# EasyEDA Pro project mspm0g3507.epro

# Schematic Schematic1
Assembly Variant: Basic; Board Name: Board1; Create Date: 2026-08-04; Page Name: P1; Project Name: mspm0g3507; Schematic Name: Schematic1; Update Date: 2026-08-04; Company: 嘉立创EDA; Page Size: A4; Version: V1.0
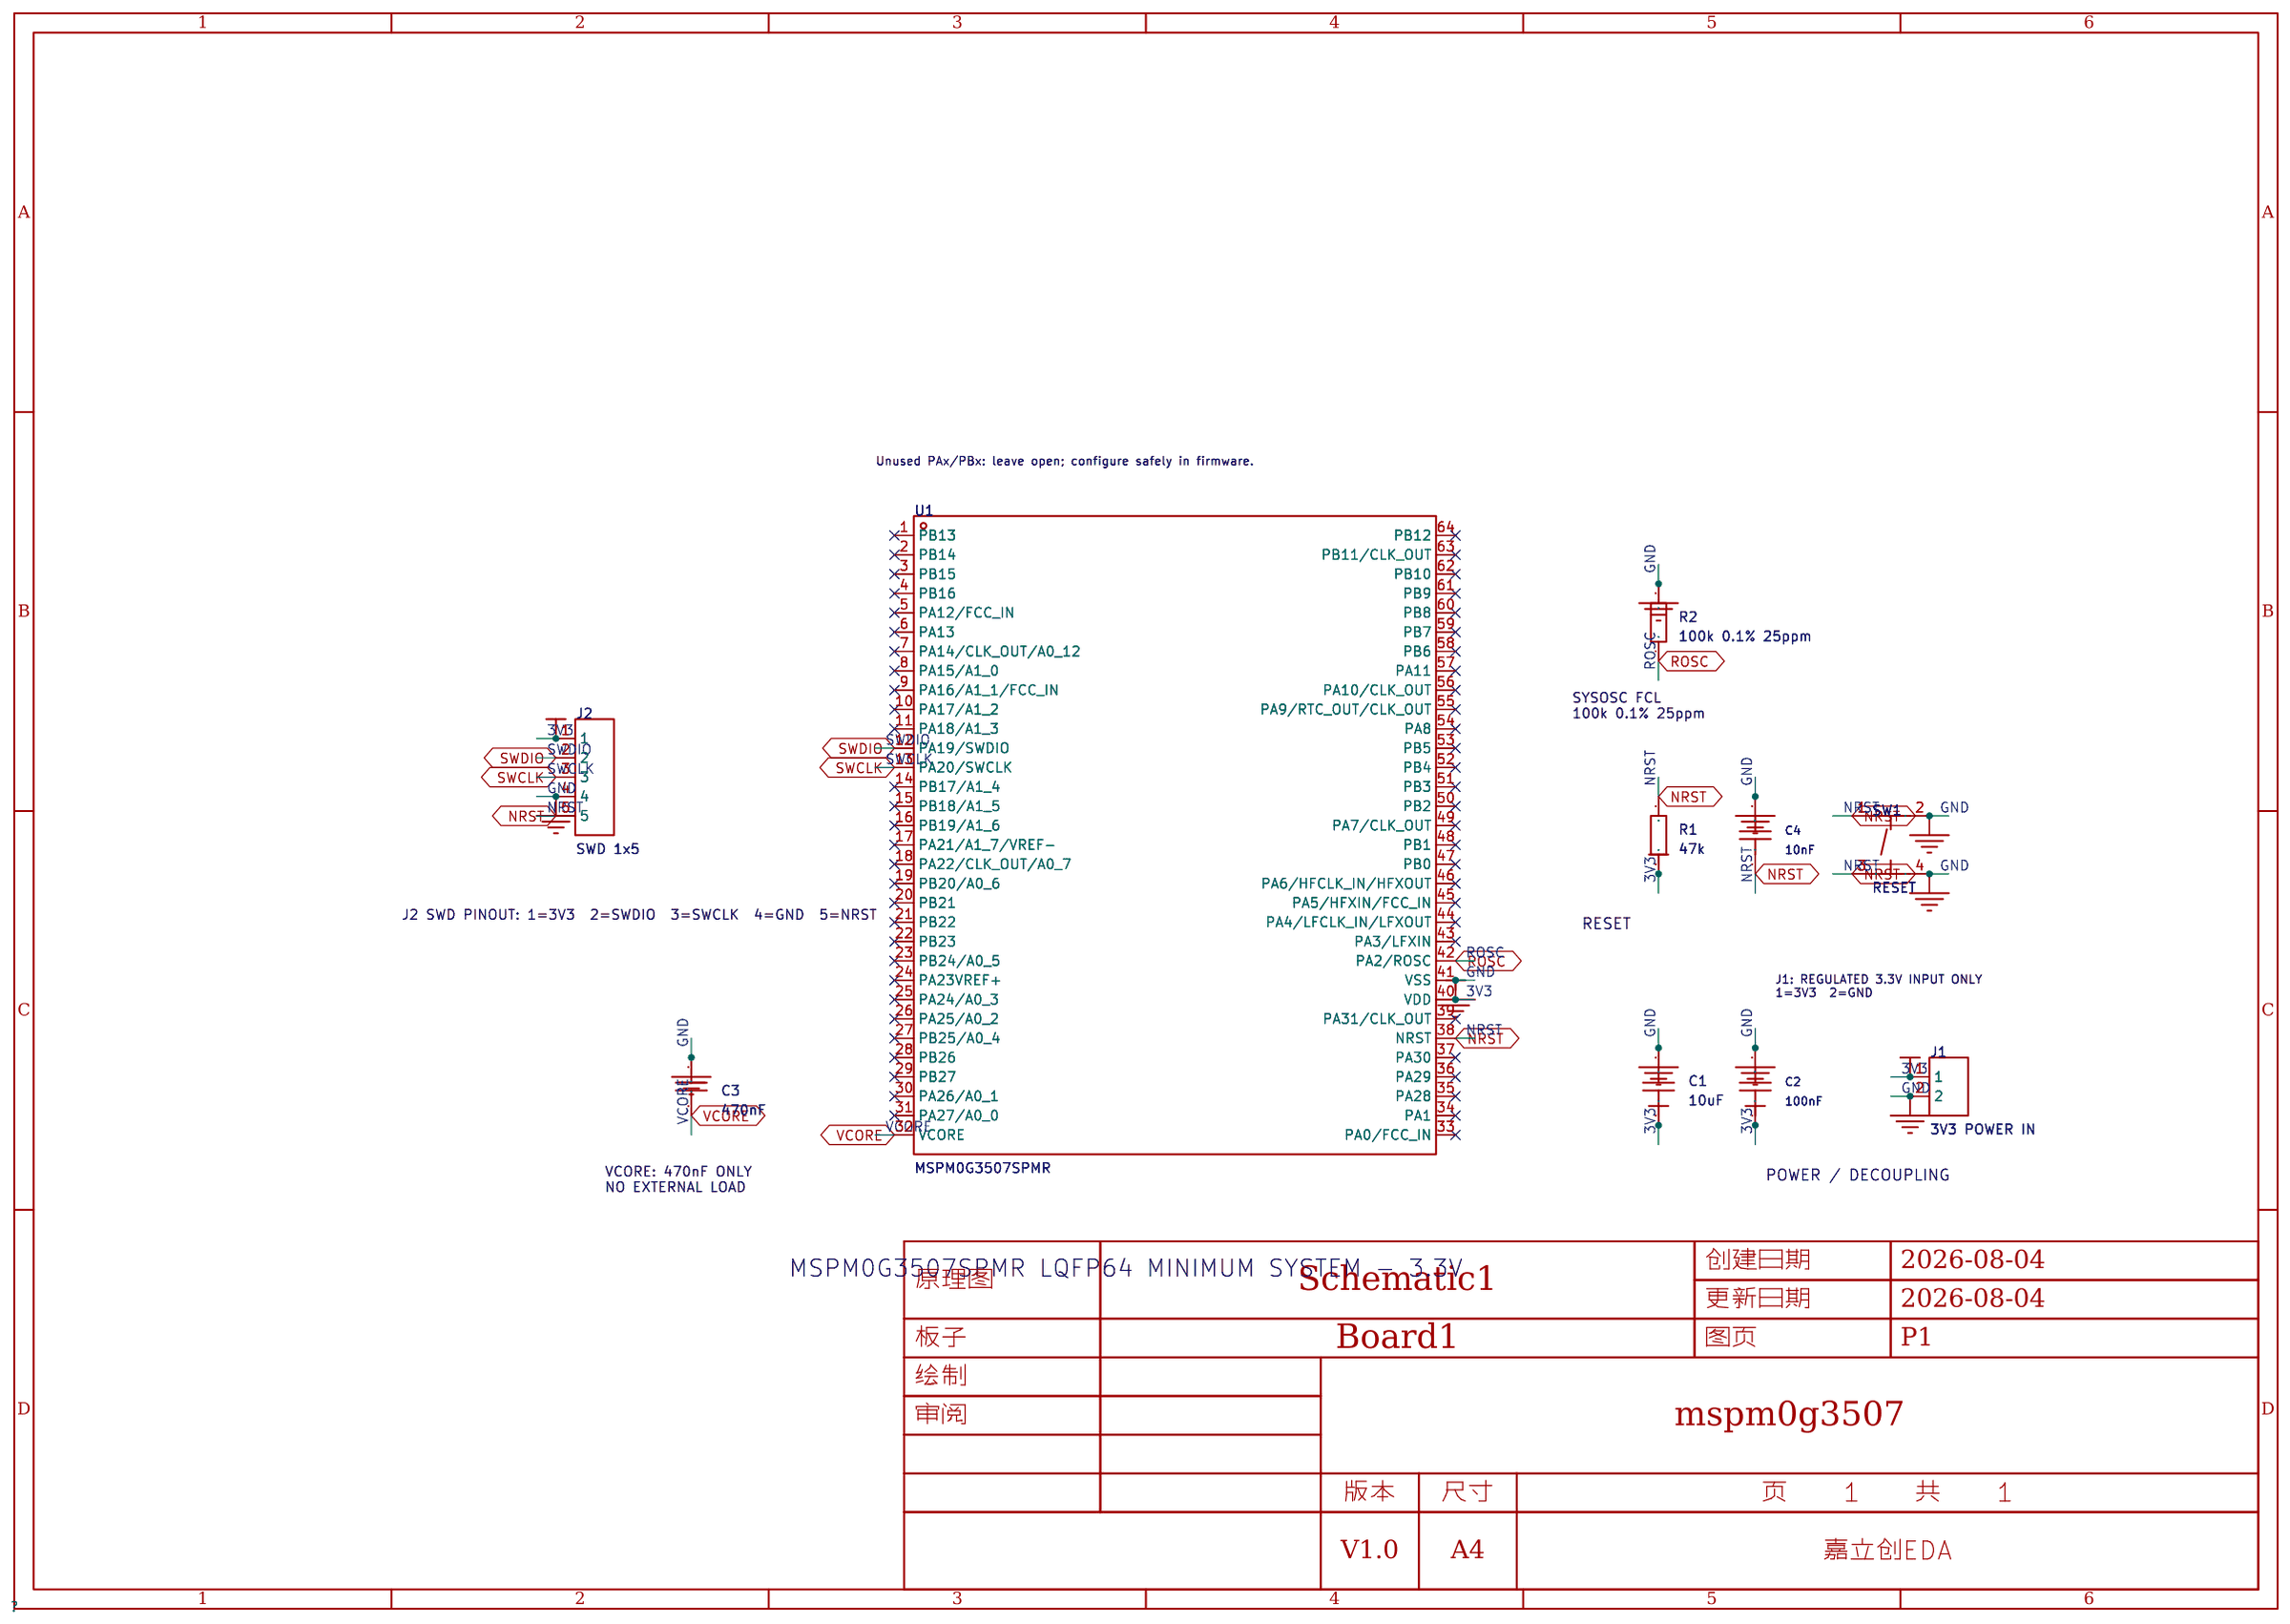
[diagram p0: schematic sheet]

## Parts
C1  10uF  [C0805]
C2  100nF  [C0603]
C3  470nF  [C0603]
C4  10nF  [C0603]
J1  3V3 POWER IN  [HDR-TH_2P-P2.54-V-M]
J2  SWD 1x5  [HDR-TH_5P-P2.54-V-M]
R1  47kΩ  [R0603]
R2  100kΩ  [R0603]
SW1  RESET  [SW-SMD_4P-L5.1-W5.1-P3.70-LS6.5-TL_H1.5]
U1  MSPM0G3507SPMR  [LQFP-64_L10.0-W10.0-P0.50-LS12.0-BL]

## Library data of the parts
C1 = CL21A106KAYNNNE_C15850: 容值:10uF;精度:±10%;额定电压:25V;温度系数:X5R;; LCSC Part Name: 10uF ±10% 25V; Supplier Part: C15850; Manufacturer: SAMSUNG(三星); Manufacturer Part: CL21A106KAYNNNE; Supplier Footprint: 0805; JLCPCB Part Class: Basic Part; Datasheet: https://item.szlcsc.com/datasheet/CL21A106KAYNNNE/16532.html; Supplier: LCSC; Tolerance: ±10%; Voltage Rating: 25V; Temperature Coefficient: X5R
C2 = CC0603KRX7R9BB104: 容值:100nF;精度:±10%;额定电压:50V;温度系数:X7R;; LCSC Part Name: 100nF ±10% 50V; Supplier Part: C14663; Manufacturer: YAGEO(国巨); Supplier Footprint: 0603; JLCPCB Part Class: Basic Part; Datasheet: https://item.szlcsc.com/datasheet/CC0603KRX7R9BB104/15331.html; Supplier: LCSC; Tolerance: ±10%; Voltage Rating: 50V; Temperature Coefficient: X7R
C3 = CL10B474KA8NNNC: 容值:470nF;精度:±10%;额定电压:25V;温度系数:X7R;; LCSC Part Name: 470nF ±10% 25V; Supplier Part: C1623; Manufacturer: SAMSUNG(三星); Supplier Footprint: 0603; JLCPCB Part Class: Basic Part; Datasheet: https://item.szlcsc.com/datasheet/CL10B474KA8NNNC/1975.html; Supplier: LCSC; Tolerance: ±10%; Voltage Rating: 25V; Temperature Coefficient: X7R
C4 = 0603B103K500NT: 容值:10nF;精度:±10%;额定电压:50V;温度系数:X7R;; LCSC Part Name: 10nF ±10% 50V; Supplier Part: C57112; Manufacturer: FH(风华); Supplier Footprint: 0603; JLCPCB Part Class: Basic Part; Datasheet: https://item.szlcsc.com/datasheet/0603B103K500NT/58143.html; Supplier: LCSC; Tolerance: ±10%; Voltage Rating: 50V; Temperature Coefficient: X7R
J1 = PZ254V-11-02P: 插针结构:1x2P;间距:2.54mm;行距:-;圆针/方针:方针;安装方式:直插;排数:单排;总PIN位数:2P;额定电流:3A;额定电压:250V;配合针长度:6mm;塑高:2.5mm;端接针长度:3mm;触头材质:黄铜;触头镀层:-;工作温度:-40℃~+105℃;颜色:黑色;; LCSC Part Name: 1x2P 间距:2.54mm 方针 直插; Supplier Part: C492401; Manufacturer: XFCN(兴飞); Supplier Footprint: 插件,P=2.54mm; JLCPCB Part Class: Extended Part; Datasheet: https://item.szlcsc.com/datasheet/PZ254V-11-02P/502957.html; Supplier: LCSC; Pin Structure: 1x2P; Pitch: 2.54mm; Circluar Pins/Square Pins: 方针; Mounting Type: 直插; Number of Rows: 单排; Number of Pins: 2P; Current Rating: 3A; Voltage Rating (Max): 250V; Length of Mating Pin: 6mm; Insulation Height: 2.5mm; Length of End Connection Pin: 3mm; Contact Material: 黄铜; Operating Temperature: -40℃~+105℃; Color: 黑色
J2 = PZ254V-11-05P: 插针结构:1x5P;间距:2.54mm;行距:-;圆针/方针:方针;安装方式:直插;排数:单排;总PIN位数:5P;额定电流:3A;额定电压:250V;配合针长度:6mm;塑高:2.5mm;端接针长度:3mm;触头材质:黄铜;触头镀层:-;工作温度:-40℃~+105℃;颜色:黑色;; LCSC Part Name: 1x5P 间距:2.54mm 方针 直插; Supplier Part: C492404; Manufacturer: XFCN(兴飞); Supplier Footprint: 插件,P=2.54mm; JLCPCB Part Class: Extended Part; Datasheet: https://item.szlcsc.com/datasheet/PZ254V-11-05P/502960.html; Supplier: LCSC; Pin Structure: 1x5P; Pitch: 2.54mm; Circluar Pins/Square Pins: 方针; Mounting Type: 直插; Number of Rows: 单排; Number of Pins: 5P; Current Rating: 3A; Voltage Rating (Max): 250V; Length of Mating Pin: 6mm; Insulation Height: 2.5mm; Length of End Connection Pin: 3mm; Contact Material: 黄铜; Operating Temperature: -40℃~+105℃; Color: 黑色
R1 = 0603WAF4702T5E: 电阻类型:厚膜电阻;阻值:47kΩ;精度:±1%;功率:100mW;工作电压:75V;温度系数:±100ppm/℃;; LCSC Part Name: 47kΩ ±1% 100mW 厚膜电阻; Supplier Part: C25819; Manufacturer: UNI-ROYAL(厚声); Supplier Footprint: 0603; JLCPCB Part Class: Basic Part; Datasheet: https://item.szlcsc.com/datasheet/0603WAF4702T5E/26562.html; Supplier: LCSC; Type: 厚膜电阻; Tolerance: ±1%; Power(Watts): 100mW; Voltage-Supply(Max): 75V; Temperature Coefficient: ±100ppm/℃; Operating Temperature: -55℃~+155℃
R2 = ERA3AEB104V: 电阻类型:薄膜电阻;阻值:100kΩ;精度:±0.1%;功率:100mW;工作电压:75V;温度系数:±25ppm/℃;; LCSC Part Name: 100kΩ ±0.1% 100mW 薄膜电阻; Supplier Part: C190609; Manufacturer: PANASONIC(松下); Supplier Footprint: 0603; JLCPCB Part Class: Extended Part; Datasheet: https://item.szlcsc.com/datasheet/ERA3AEB104V/211203.html; Supplier: LCSC; Type: 薄膜电阻; Tolerance: ±0.1%; Power(Watts): 100mW; Voltage-Supply(Max): 75V; Temperature Coefficient: ±25ppm/℃; Operating Temperature: -55℃~+155℃
SW1 = TS-1187A-B-A-B: 电路结构:单刀单掷;按钮形状:圆形按钮;作用力:1.6N;安装方式:立贴;开关长度:5.1mm;开关宽度:5.1mm;开关高度:1.5mm;带支架:不带支架;触点电流:50mA;额定电压:12V;带灯:无;工作寿命:10万次;; LCSC Part Name: 5.1*5.1*1.5mm 立贴 轻触开关; Supplier Part: C318884; Manufacturer: XKB Connection(中国星坤); Supplier Footprint: SMD-4P,5.1x5.1mm; JLCPCB Part Class: Basic Part; Datasheet: https://item.szlcsc.com/datasheet/TS-1187A-B-A-B/299976.html; Supplier: LCSC; Circuit: 单刀单掷; Actuator Style: 圆形按钮; Operating Force: 1.6N; Mounting Type: 立贴; Length: 5.1mm; Width: 5.1mm; Switch Height: 1.5mm; with Bracket: 不带支架; Contact Current: 50mA; Voltage Rating: 12V; Actuator/Cap Color: 金色; With Lamp: 无; Life: 10万次; Operating Temperature: -30℃~+85℃
U1 = MSPM0G3507SPMR_C22389960: CPU内核:ARM Cortex-M0+;CPU最大主频:80MHz;CPU位数:32 Bit;; LCSC Part Name: 3.81mm间距线对板和线对线连接器; Supplier Part: C22389960; Manufacturer: TI(德州仪器); Supplier Footprint: LQFP-64(10x10); JLCPCB Part Class: Extended Part; Datasheet: https://www.ti.com.cn/cn/lit/ds/symlink/mspm0g3507.pdf; Supplier: LCSC; CPU Core: ARM Cortex-M0+; CPU Maximum Speed: 80MHz; Core Size: 32 Bit; Program Storage Size: 128KB; Program Memory Type: FLASH; RAM Size: 32KB; Number of I/O: 60; Oscillator Type: 内置+外置; Voltage - Supply: 1.62V~3.6V; Operating Temperature: -40℃~+125℃

## Nets
3V3: C1.1 C2.1 J1.1 J2.1 R1.1 U1.40(VDD)
GND: C1.2 C2.2 C3.2 C4.2 J1.2 J2.4 R2.2 SW1.2(B) SW1.4(D) U1.41(VSS)
NRST: C4.1 J2.5 R1.2 SW1.1(A) SW1.3(C) U1.38(NRST)
ROSC: R2.1 U1.42(PA2/ROSC)
SWCLK: J2.3 U1.13(PA20/SWCLK)
SWDIO: J2.2 U1.12(PA19/SWDIO)
VCORE: C3.1 U1.32(VCORE)

Not connected (* = marked no-connect by the designer): U1 1(PB13)* 2(PB14)* 3(PB15)* 4(PB16)* 5(PA12/FCC_IN)* 6(PA13)* 7(PA14/CLK_OUT/A0_12)* 8(PA15/A1_0)* 9(PA16/A1_1/FCC_IN)* 10(PA17/A1_2)* 11(PA18/A1_3)* 14(PB17/A1_4)* 15(PB18/A1_5)* 16(PB19/A1_6)* 17(PA21/A1_7/VREF-)* 18(PA22/CLK_OUT/A0_7)* 19(PB20/A0_6)* 20(PB21)* 21(PB22)* 22(PB23)* 23(PB24/A0_5)* 24(PA23VREF+)* 25(PA24/A0_3)* 26(PA25/A0_2)* 27(PB25/A0_4)* 28(PB26)* 29(PB27)* 30(PA26/A0_1)* 31(PA27/A0_0)* 33(PA0/FCC_IN)* 34(PA1)* 35(PA28)* 36(PA29)* 37(PA30)* 39(PA31/CLK_OUT)* 43(PA3/LFXIN)* 44(PA4/LFCLK_IN/LFXOUT)* 45(PA5/HFXIN/FCC_IN)* 46(PA6/HFCLK_IN/HFXOUT)* 47(PB0)* 48(PB1)* 49(PA7/CLK_OUT)* 50(PB2)* 51(PB3)* 52(PB4)* 53(PB5)* 54(PA8)* 55(PA9/RTC_OUT/CLK_OUT)* 56(PA10/CLK_OUT)* 57(PA11)* 58(PB6)* 59(PB7)* 60(PB8)* 61(PB9)* 62(PB10)* 63(PB11/CLK_OUT)* 64(PB12)*

## Notes on the sheet
- Unused PAx/PBx: leave open; configure safely in firmware.
- SYSOSC FCL
  100k 0.1% 25ppm
- J2 SWD PINOUT: 1=3V3  2=SWDIO  3=SWCLK  4=GND  5=NRST
- RESET
- J1: REGULATED 3.3V INPUT ONLY
  1=3V3  2=GND
- VCORE: 470nF ONLY
  NO EXTERNAL LOAD
- POWER / DECOUPLING
- MSPM0G3507SPMR LQFP64 MINIMUM SYSTEM - 3.3V

# Board PCB1
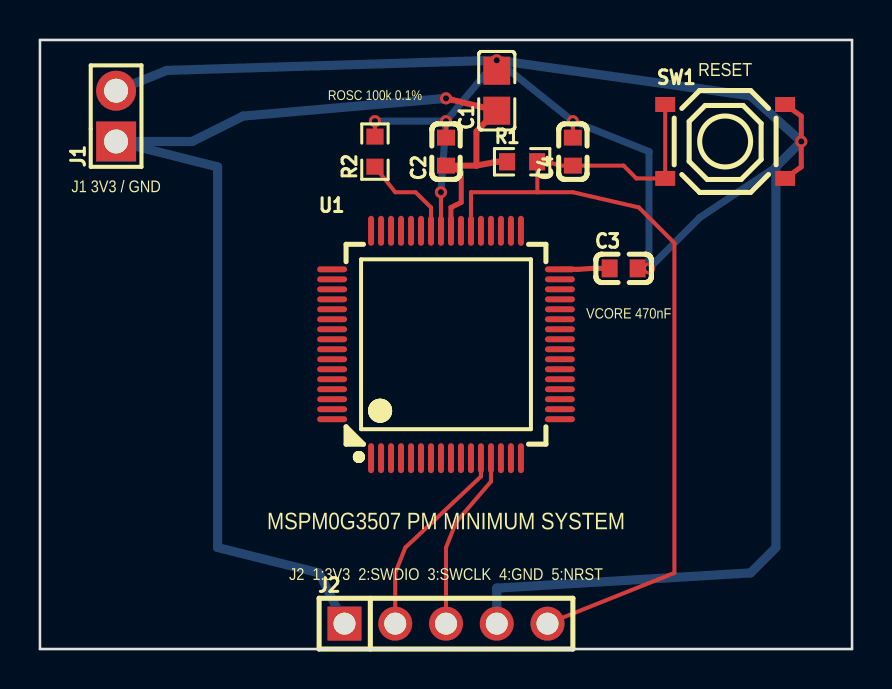
[diagram p1: board, top side]
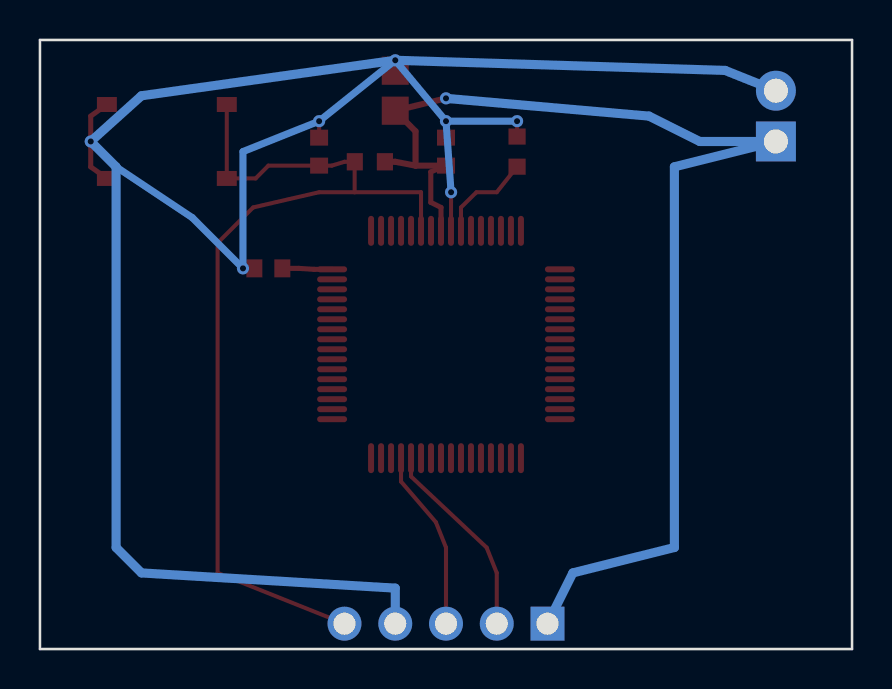
[diagram p2: board, bottom side, seen from below]

Outline 40.64 x 30.48 mm; copper layers: Top Layer, Bottom Layer. Coordinates in mm from the lower left corner of the outline.
Outline path: 0,30.48 0,0 40.64,0 40.64,30.48 0,30.48
Stack: Top Layer 0.035mm / Dielectric1 1.51mm FR4 er 4.5 / Bottom Layer 0.035mm

## Design rules (mm)
spacing copperThickness1oz (default): track to track 0.102, other pairs 0.152 to 0.3
spacing copperThickness2oz: track to track 0.203, other pairs 0.152 to 0.3
track width copperThickness1oz (default): min 0.127, default 0.254, max 2.54
track width copperThickness2oz: min 0.203, default 0.254, max 2.54
differential pair differentialPair (default): width min 0.127, default 0.254, max 2.54; gap min 0.152, default 0.152

## Placement (name value [footprint] x y rotation side)
C1  10uF  [C0805]  22.86 27.94 90 top
C2  100nF  [C0603]  20.32 24.89 90 top
C3  470nF  [C0603]  29.21 19.05 0 top
C4  10nF  [C0603]  26.67 24.89 90 top
J1  3V3 POWER IN  [HDR-TH_2P-P2.54-V-M]  3.81 26.67 90 top
J2  SWD 1x5  [HDR-TH_5P-P2.54-V-M]  20.32 1.27 0 top
R1  47kΩ  [R0603]  24.13 24.38 0 top
R2  100kΩ  [R0603]  16.76 24.89 90 top
SW1  RESET  [SW-SMD_4P-L5.1-W5.1-P3.70-LS6.5-TL_H1.5]  34.29 25.4 0 top
U1  MSPM0G3507SPMR  [LQFP-64_L10.0-W10.0-P0.50-LS12.0-BL]  20.32 15.24 0 top

## Footprints (pads in the part's own frame, mm; a bottom-side part is the same pattern mirrored in y, then rotated)
C0603
  rect 0.8x0.9 smd: 1(-0.7,0) 2(0.7,0)
C0805
  rect 1.41x1.35 smd: 1(-1,0) 2(1,0)
HDR-TH_2P-P2.54-V-M
  rect 2x2 hole 1.2: 1(-1.27,0)
  round 2 hole 1.2: 2(1.27,0)
HDR-TH_5P-P2.54-V-M
  rect 1.7x1.7 hole 1.1: 1(-5.08,0)
  round 1.7 hole 1.1: 2(-2.54,0) 3(0,0) 4(2.54,0) 5(5.08,0)
LQFP-64_L10.0-W10.0-P0.50-LS12.0-BL
  oval 0.3x1.5 smd: 1(-3.75,-5.688) 2(-3.25,-5.688) 3(-2.75,-5.688) 4(-2.25,-5.688) 5(-1.75,-5.688) 6(-1.25,-5.688) 7(-0.75,-5.688) 8(-0.25,-5.688) 9(0.25,-5.688) 10(0.75,-5.688) 11(1.25,-5.688) 12(1.75,-5.688) 13(2.25,-5.688) 14(2.75,-5.688) 15(3.25,-5.688) 16(3.75,-5.688) 33(3.75,5.688) 34(3.25,5.688) 35(2.75,5.688) 36(2.25,5.688) 37(1.75,5.688) 38(1.25,5.688) 39(0.75,5.688) 40(0.25,5.688) 41(-0.25,5.688) 42(-0.75,5.688) 43(-1.25,5.688) 44(-1.75,5.688) 45(-2.25,5.688) 46(-2.75,5.688) 47(-3.25,5.688) 48(-3.75,5.688)
  oval 1.5x0.3 smd: 17(5.7,-3.738) 18(5.7,-3.238) 19(5.7,-2.738) 20(5.7,-2.238) 21(5.7,-1.738) 22(5.7,-1.238) 23(5.7,-0.739) 24(5.7,-0.238) 25(5.7,0.262) 26(5.7,0.762) 27(5.7,1.262) 28(5.7,1.762) 29(5.7,2.261) 30(5.7,2.762) 31(5.7,3.261) 32(5.7,3.762) 49(-5.7,3.762) 50(-5.7,3.261) 51(-5.7,2.762) 52(-5.7,2.261) 53(-5.7,1.762) 54(-5.7,1.262) 55(-5.7,0.762) 56(-5.7,0.262) 57(-5.7,-0.238) 58(-5.7,-0.739) 59(-5.7,-1.238) 60(-5.7,-1.738) 61(-5.7,-2.238) 62(-5.7,-2.738) 63(-5.7,-3.238) 64(-5.7,-3.738)
R0603
  rect 0.806x0.864 smd: 1(-0.753,0) 2(0.753,0)
SW-SMD_4P-L5.1-W5.1-P3.70-LS6.5-TL_H1.5
  rect 1x0.75 smd: 1(-3,1.85) 2(3,1.85) 3(-3,-1.85) 4(3,-1.85)

## Nets
As in the schematic.

Pads without a net: U1 1 2 3 4 5 6 7 8 9 10 11 14 15 16 17 18 19 20 21 22 23 24 25 26 27 28 29 30 31 33 34 35 36 37 39 43 44 45 46 47 48 49 50 51 52 53 54 55 56 57 58 59 60 61 62 63 64

## Via types
v1: diameter 0.61, hole 0.305, Top Layer to Bottom Layer, 8 vias

## Routing (per net, layer and track width the routed paths; a pad name or vN(x,y) marks a point on that pad's centre or on a via; arc(x,y) is an arc through that point)
3V3: length 62.2
  Top Layer w0.254: C2.1 21.08,23.88 21.08,22.35 20.57,22.1 20.57,20.93
  Top Layer w0.305: C2.1 21.84,24.19 ; 21.84,24.19 21.84,25.91 C1.1 v1(20.32,27.56) ; 21.84,24.19 22.86,24.38 R1.1
  Bottom Layer w0.457: J2.1 13.97,3.81 8.89,5.08 8.89,24.13 J1.1 7.62,25.4 10.16,26.67 v1(20.32,27.56)
GND: length 116.7
  Top Layer w0.203: C4.2 v1(26.67,26.42) ; C1.2 v1(22.86,29.46) ; C2.2 v1(20.32,26.42) ; R2.2 v1(16.76,26.42) ; 29.91,19.05 v1(30.48,19.05) ; 20.07,20.93 v1(20.07,22.86)
  Top Layer w0.254: 37.29,27.25 38.1,26.67 v1(38.1,25.4) 38.1,24.13 37.29,23.55
  Bottom Layer w0.355: v1(20.07,22.86) v1(20.32,26.42) ; v1(20.32,26.42) v1(16.76,26.42) ; v1(20.32,26.42) v1(22.86,29.46) v1(26.67,26.42) 30.48,24.89 v1(30.48,19.05) 33.02,21.59 36.83,24.13
  Bottom Layer w0.457: J2.4 22.86,3.05 35.56,3.81 36.83,5.08 36.83,24.13 v1(38.1,25.4) 35.56,27.69 v1(22.86,29.46) 6.35,28.96 J1.2
NRST: length 48.2
  Top Layer w0.203: 24.89,22.86 21.57,22.86 U1.38 ; 24.89,22.86 24.89,24.38 ; 24.89,22.86 26.67,22.86 29.97,22.1 31.75,20.32 31.75,3.81 J2.5 ; 24.89,24.38 R1.2 ; 24.89,24.38 25.4,24.38 26.03,24.19 C4.1 29.21,24.19 29.84,23.55 31.29,23.55 31.29,27.25
ROSC: length 4.9
  Top Layer w0.203: U1.42 19.57,22.1 18.8,22.86 17.78,22.86 R2.1
SWCLK: length 9
  Top Layer w0.203: J2.3 20.32,5.08 20.83,6.35 22.57,8.38 U1.13
SWDIO: length 10
  Top Layer w0.203: J2.2 17.78,3.81 18.29,5.08 22.07,8.64 U1.12
VCORE: length 2.5
  Top Layer w0.254: U1.32 26.92,19 27.69,19.05 28.51,19.05

## Text on the board
Top Silkscreen Layer: ROSC 100k 0.1% | VCORE 470nF | J2  1:3V3  2:SWDIO  3:SWCLK  4:GND  5:NRST | J1 3V3 / GND | RESET | MSPM0G3507 PM MINIMUM SYSTEM
